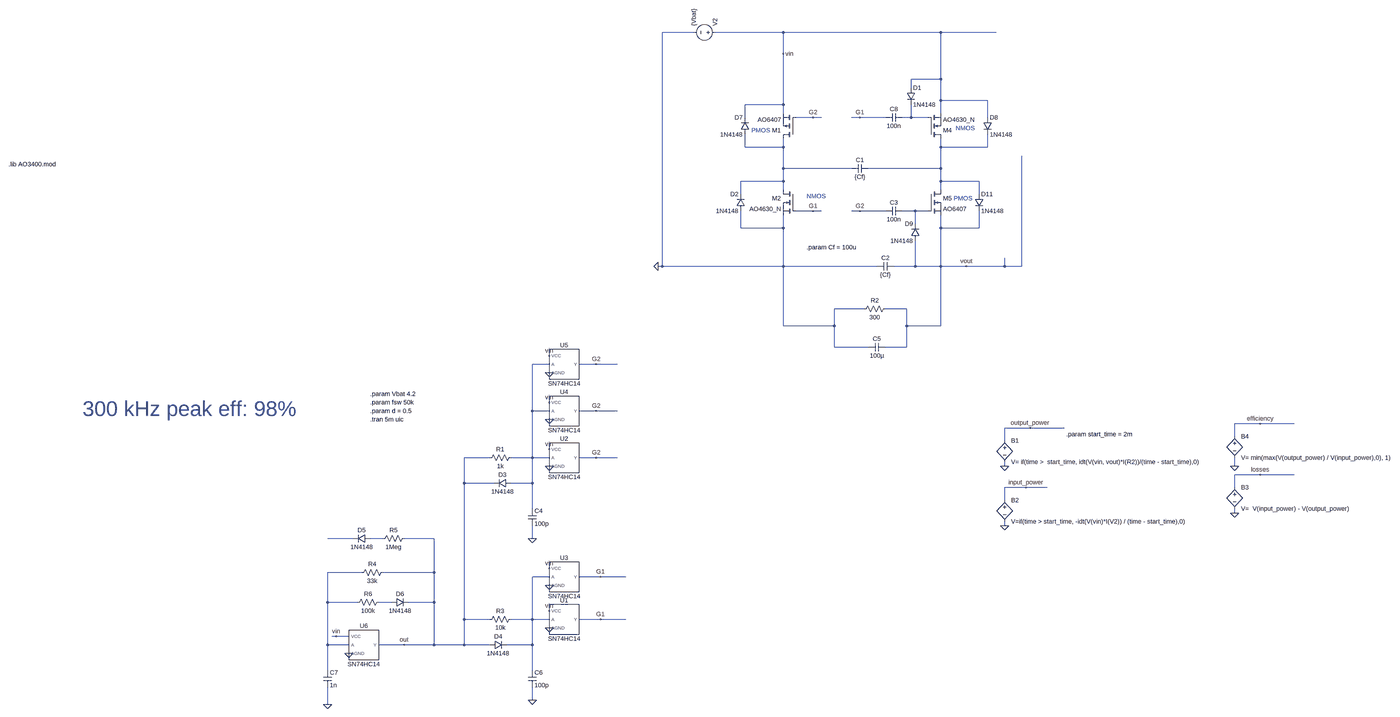
[diagram p0: schematic complete_charge_pump_with_boost.asc, whole sheet]
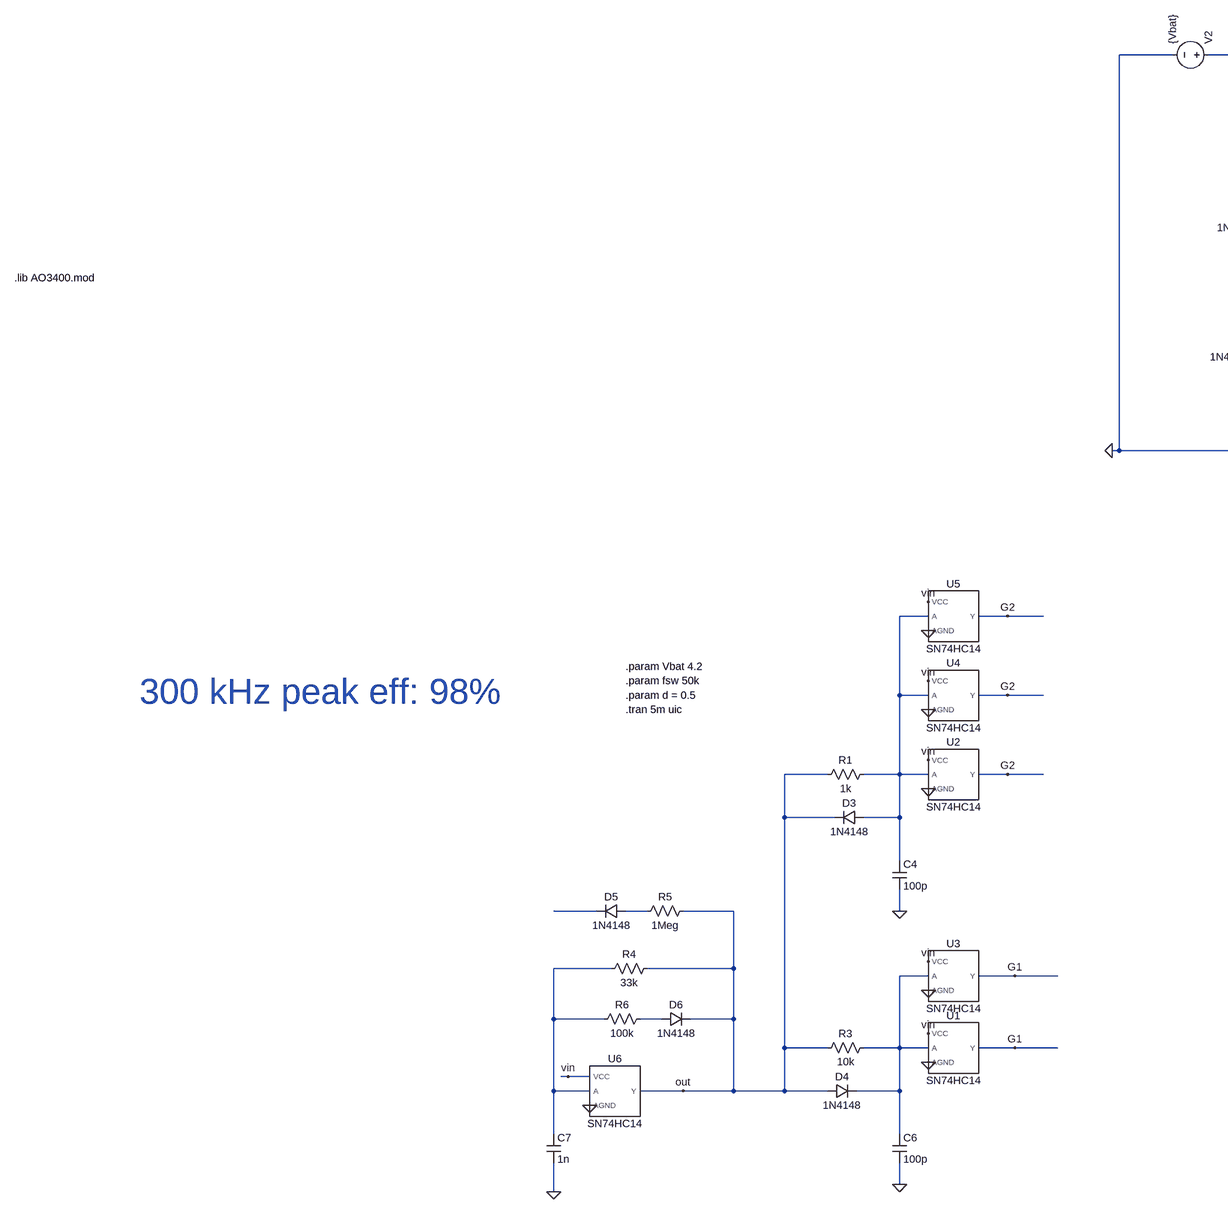
[diagram p1: schematic complete_charge_pump_with_boost.asc, part, row 1 of 1, column 1 of 2]
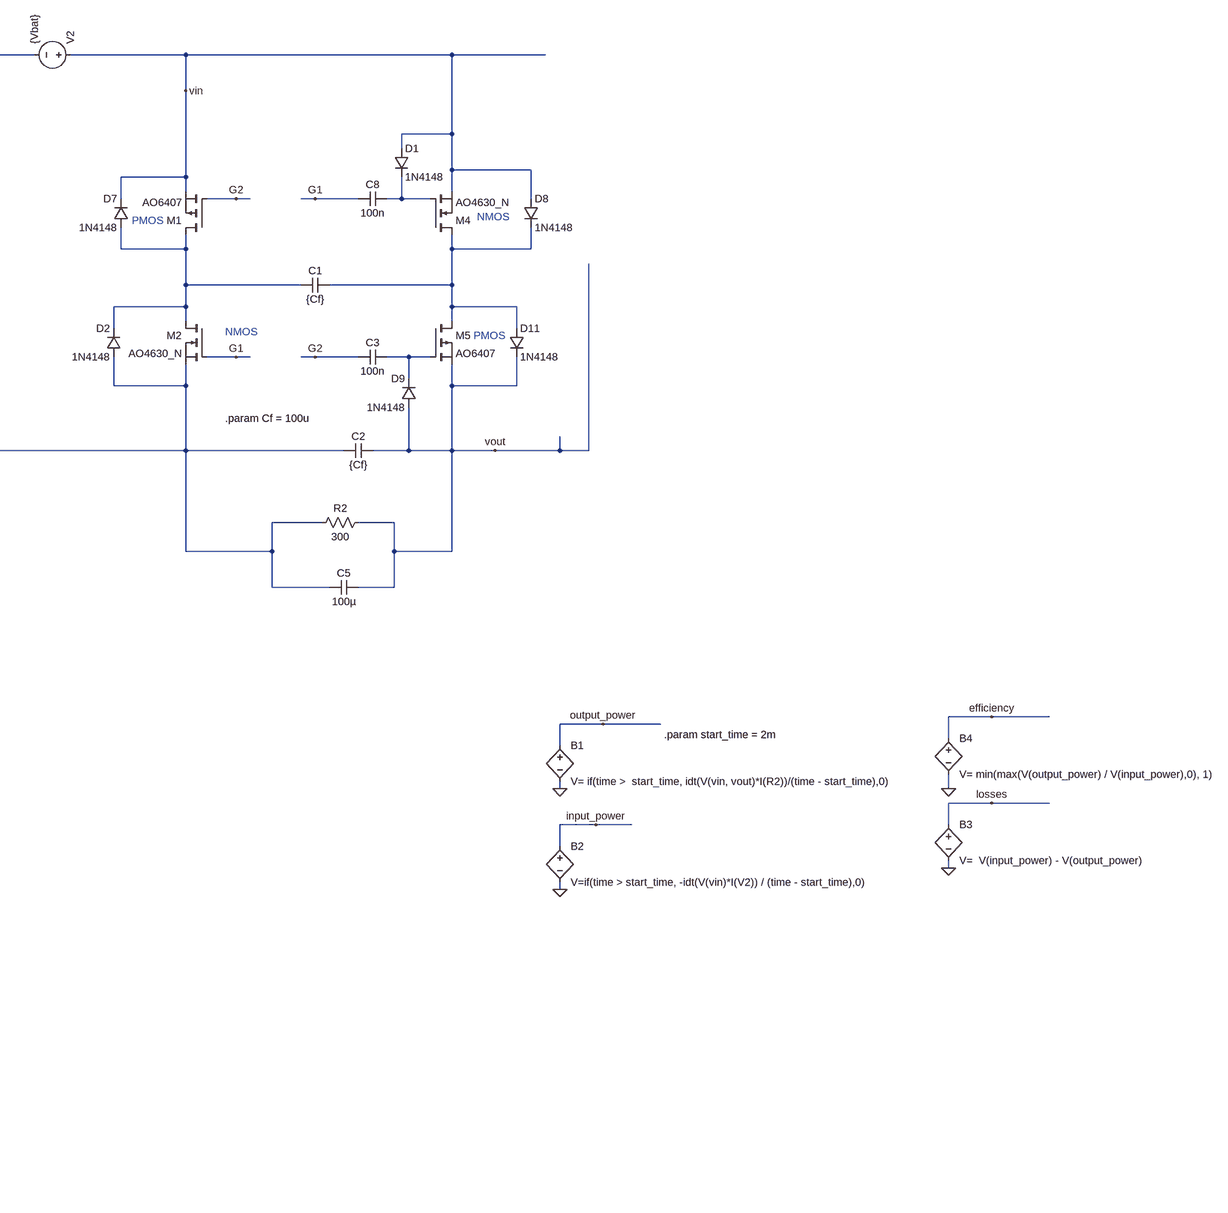
[diagram p2: schematic complete_charge_pump_with_boost.asc, part, row 1 of 1, column 2 of 2]
complete_charge_pump_with_boost.asc, the LTspice schematic file:
Version 4
SHEET 1 11460 3748
WIRE 2096 -384 1824 -384
WIRE 2432 -384 2176 -384
WIRE 3024 -384 2432 -384
WIRE 3232 -384 3024 -384
WIRE 2432 -304 2432 -384
WIRE 3024 -208 3024 -384
WIRE 3024 -208 2912 -208
WIRE 2912 -176 2912 -208
WIRE 3024 -128 3024 -208
WIRE 3200 -128 3024 -128
WIRE 2432 -112 2432 -304
WIRE 2432 -112 2288 -112
WIRE 2432 -80 2432 -112
WIRE 3024 -80 3024 -128
WIRE 2288 -64 2288 -112
WIRE 2544 -64 2480 -64
WIRE 2576 -64 2544 -64
WIRE 2720 -64 2688 -64
WIRE 2816 -64 2720 -64
WIRE 2912 -64 2912 -112
WIRE 2912 -64 2880 -64
WIRE 2976 -64 2912 -64
WIRE 3200 -64 3200 -128
WIRE 2288 48 2288 0
WIRE 2432 48 2432 16
WIRE 2432 48 2288 48
WIRE 3024 48 3024 16
WIRE 3200 48 3200 0
WIRE 3200 48 3024 48
WIRE 2432 128 2432 48
WIRE 2688 128 2432 128
WIRE 3024 128 3024 48
WIRE 3024 128 2752 128
WIRE 2432 176 2432 128
WIRE 2432 176 2272 176
WIRE 3024 176 3024 128
WIRE 3168 176 3024 176
WIRE 2432 208 2432 176
WIRE 3024 208 3024 176
WIRE 2272 224 2272 176
WIRE 3168 224 3168 176
WIRE 2544 288 2480 288
WIRE 2576 288 2544 288
WIRE 2720 288 2688 288
WIRE 2816 288 2720 288
WIRE 2928 288 2880 288
WIRE 2976 288 2928 288
WIRE 2928 336 2928 288
WIRE 2272 352 2272 288
WIRE 2432 352 2432 304
WIRE 2432 352 2272 352
WIRE 3024 352 3024 304
WIRE 3168 352 3168 288
WIRE 3168 352 3024 352
WIRE 1824 496 1824 -384
WIRE 1824 496 1808 496
WIRE 2432 496 2432 352
WIRE 2432 496 1824 496
WIRE 2784 496 2432 496
WIRE 2928 496 2928 400
WIRE 2928 496 2848 496
WIRE 3024 496 3024 352
WIRE 3024 496 2928 496
WIRE 3120 496 3024 496
WIRE 3264 496 3264 464
WIRE 3264 496 3120 496
WIRE 3328 496 3328 80
WIRE 3328 496 3264 496
WIRE 2736 656 2624 656
WIRE 2896 656 2816 656
WIRE 2432 720 2432 496
WIRE 2624 720 2624 656
WIRE 2624 720 2432 720
WIRE 2896 720 2896 656
WIRE 3024 720 3024 496
WIRE 3024 720 2896 720
WIRE 2624 800 2624 720
WIRE 2752 800 2624 800
WIRE 2896 800 2896 720
WIRE 2896 800 2816 800
WIRE 1168 864 1104 864
WIRE 1344 864 1280 864
WIRE 1424 864 1344 864
WIRE 1104 1040 1104 864
WIRE 1168 1040 1104 1040
WIRE 1344 1040 1280 1040
WIRE 1424 1040 1344 1040
WIRE 4224 1088 4128 1088
WIRE 4352 1088 4224 1088
WIRE 3360 1104 3264 1104
WIRE 3488 1104 3360 1104
WIRE 4128 1136 4128 1088
WIRE 3264 1152 3264 1104
WIRE 944 1216 848 1216
WIRE 1104 1216 1104 1040
WIRE 1104 1216 1024 1216
WIRE 1168 1216 1104 1216
WIRE 1344 1216 1280 1216
WIRE 1424 1216 1344 1216
WIRE 3264 1248 3264 1232
WIRE 4128 1248 4128 1216
WIRE 4224 1280 4128 1280
WIRE 4352 1280 4224 1280
WIRE 848 1312 848 1216
WIRE 960 1312 848 1312
WIRE 1104 1312 1104 1216
WIRE 1104 1312 1024 1312
WIRE 3344 1328 3264 1328
WIRE 3424 1328 3344 1328
WIRE 4128 1328 4128 1280
WIRE 3264 1376 3264 1328
WIRE 1104 1408 1104 1312
WIRE 4128 1424 4128 1408
WIRE 3264 1472 3264 1456
WIRE 416 1520 320 1520
WIRE 528 1520 480 1520
WIRE 720 1520 608 1520
WIRE 1104 1520 1104 1472
WIRE 448 1648 320 1648
WIRE 720 1648 720 1520
WIRE 720 1648 528 1648
WIRE 1168 1664 1104 1664
WIRE 1360 1664 1280 1664
WIRE 1456 1664 1360 1664
WIRE 320 1760 320 1648
WIRE 432 1760 320 1760
WIRE 560 1760 512 1760
WIRE 720 1760 720 1648
WIRE 720 1760 624 1760
WIRE 848 1824 848 1312
WIRE 944 1824 848 1824
WIRE 1104 1824 1104 1664
WIRE 1104 1824 1024 1824
WIRE 1168 1824 1104 1824
WIRE 1360 1824 1280 1824
WIRE 1456 1824 1360 1824
WIRE 352 1888 336 1888
WIRE 400 1888 352 1888
WIRE 320 1920 320 1760
WIRE 400 1920 320 1920
WIRE 608 1920 512 1920
WIRE 720 1920 720 1760
WIRE 720 1920 608 1920
WIRE 848 1920 848 1824
WIRE 848 1920 720 1920
WIRE 944 1920 848 1920
WIRE 1104 1920 1104 1824
WIRE 1104 1920 1008 1920
WIRE 320 2016 320 1920
WIRE 1104 2016 1104 1920
WIRE 1104 2128 1104 2080
WIRE 320 2144 320 2080
FLAG 1808 496 0
FLAG 2544 288 G1
FLAG 2544 -64 G2
FLAG 2720 -64 G1
FLAG 3264 1248 0
FLAG 3264 1472 0
FLAG 3360 1104 output_power
FLAG 3344 1328 input_power
FLAG 4128 1248 0
FLAG 4224 1088 efficiency
FLAG 4128 1424 0
FLAG 4224 1280 losses
FLAG 2432 -304 vin
FLAG 3120 496 vout
FLAG 1104 1520 0
FLAG 1104 2128 0
FLAG 1168 1856 0
FLAG 1168 1248 0
FLAG 1168 1184 vin
FLAG 1168 1792 vin
FLAG 1360 1824 G1
FLAG 1344 1216 G2
FLAG 1168 1696 0
FLAG 1168 1632 vin
FLAG 1360 1664 G1
FLAG 1168 1072 0
FLAG 1168 1008 vin
FLAG 1344 1040 G2
FLAG 1168 896 0
FLAG 1168 832 vin
FLAG 1344 864 G2
FLAG 320 2144 0
FLAG 400 1952 0
FLAG 608 1920 out
FLAG 352 1888 vin
FLAG 2720 288 G2
SYMBOL cap 2752 112 R90
WINDOW 0 0 32 VBottom 2
WINDOW 3 32 32 VTop 2
SYMATTR InstName C1
SYMATTR Value {Cf}
SYMBOL cap 2784 512 R270
WINDOW 0 32 32 VTop 2
WINDOW 3 0 32 VBottom 2
SYMATTR InstName C2
SYMATTR Value {Cf}
SYMBOL voltage 2192 -384 M270
WINDOW 123 0 0 Left 0
WINDOW 39 0 0 Left 0
SYMATTR InstName V2
SYMATTR Value {Vbat}
SYMBOL res 2832 640 R90
WINDOW 0 0 56 VBottom 2
WINDOW 3 32 56 VTop 2
SYMATTR InstName R2
SYMATTR Value 300
SYMBOL pmos 2480 16 R180
SYMATTR InstName M1
SYMATTR Value AO6407
SYMBOL nmos 2480 208 M0
SYMATTR InstName M2
SYMATTR Value AO4630_N
SYMBOL nmos 2976 16 M180
SYMATTR InstName M4
SYMATTR Value AO4630_N
SYMBOL bv 3264 1136 R0
SYMATTR InstName B1
SYMATTR Value V= if(time >  start_time, idt(V(vin, vout)*I(R2))/(time - start_time),0)
SYMBOL bv 3264 1360 R0
SYMATTR InstName B2
SYMATTR Value V=if(time > start_time, -idt(V(vin)*I(V2)) / (time - start_time),0)
SYMBOL bv 4128 1312 R0
SYMATTR InstName B3
SYMATTR Value V=  V(input_power) - V(output_power)
SYMBOL bv 4128 1120 R0
SYMATTR InstName B4
SYMATTR Value V= min(max(V(output_power) / V(input_power),0), 1)
SYMBOL res 1040 1200 R90
WINDOW 0 0 56 VBottom 2
WINDOW 3 32 56 VTop 2
SYMATTR InstName R1
SYMATTR Value 1k
SYMBOL cap 1088 1408 R0
SYMATTR InstName C4
SYMATTR Value 100p
SYMBOL diode 1024 1296 R90
WINDOW 0 0 32 VBottom 2
WINDOW 3 32 32 VTop 2
SYMATTR InstName D3
SYMATTR Value 1N4148
SYMBOL res 1040 1808 R90
WINDOW 0 0 56 VBottom 2
WINDOW 3 32 56 VTop 2
SYMATTR InstName R3
SYMATTR Value 10k
SYMBOL diode 944 1936 R270
WINDOW 0 32 32 VTop 2
WINDOW 3 0 32 VBottom 2
SYMATTR InstName D4
SYMATTR Value 1N4148
SYMBOL cap 1088 2016 R0
SYMATTR InstName C6
SYMATTR Value 100p
SYMBOL SN74HC14 1216 1808 R0
SYMATTR InstName U1
SYMBOL SN74HC14 1216 1200 R0
SYMATTR InstName U2
SYMBOL SN74HC14 1216 1648 R0
SYMATTR InstName U3
SYMBOL SN74HC14 1216 1024 R0
SYMATTR InstName U4
SYMBOL SN74HC14 1216 848 R0
SYMATTR InstName U5
SYMBOL cap 2752 816 R270
WINDOW 0 32 32 VTop 2
WINDOW 3 0 32 VBottom 2
SYMATTR InstName C5
SYMATTR Value 100µ
SYMBOL SN74HC14 448 1904 R0
SYMATTR InstName U6
SYMBOL res 544 1632 R90
WINDOW 0 0 56 VBottom 2
WINDOW 3 32 56 VTop 2
SYMATTR InstName R4
SYMATTR Value 33k
SYMBOL cap 304 2016 R0
SYMATTR InstName C7
SYMATTR Value 1n
SYMBOL diode 480 1504 R90
WINDOW 0 0 32 VBottom 2
WINDOW 3 32 32 VTop 2
SYMATTR InstName D5
SYMATTR Value 1N4148
SYMBOL res 624 1504 R90
WINDOW 0 0 56 VBottom 2
WINDOW 3 32 56 VTop 2
SYMATTR InstName R5
SYMATTR Value 1Meg
SYMBOL diode 560 1776 R270
WINDOW 0 32 32 VTop 2
WINDOW 3 0 32 VBottom 2
SYMATTR InstName D6
SYMATTR Value 1N4148
SYMBOL res 416 1776 R270
WINDOW 0 32 56 VTop 2
WINDOW 3 0 56 VBottom 2
SYMATTR InstName R6
SYMATTR Value 100k
SYMBOL diode 2288 288 R180
WINDOW 0 24 64 Left 2
WINDOW 3 24 0 Left 2
SYMATTR InstName D2
SYMATTR Value 1N4148
SYMBOL diode 2304 0 R180
WINDOW 0 24 64 Left 2
WINDOW 3 24 0 Left 2
SYMATTR InstName D7
SYMATTR Value 1N4148
SYMBOL diode 3184 -64 R0
SYMATTR InstName D8
SYMATTR Value 1N4148
SYMBOL diode 2944 400 R180
WINDOW 0 24 64 Left 2
WINDOW 3 24 0 Left 2
SYMATTR InstName D9
SYMATTR Value 1N4148
SYMBOL pmos 2976 208 R0
SYMATTR InstName M5
SYMATTR Value AO6407
SYMBOL diode 3152 224 R0
SYMATTR InstName D11
SYMATTR Value 1N4148
SYMBOL cap 2880 272 R90
WINDOW 0 0 32 VBottom 2
WINDOW 3 32 32 VTop 2
SYMATTR InstName C3
SYMATTR Value 100n
SYMBOL diode 2896 -176 R0
SYMATTR InstName D1
SYMATTR Value 1N4148
SYMBOL cap 2880 -80 R90
WINDOW 0 0 32 VBottom 2
WINDOW 3 32 32 VTop 2
SYMATTR InstName C8
SYMATTR Value 100n
TEXT 480 1008 Left 2 !.param fsw 50k
TEXT 480 1040 Left 2 !.param d = 0.5
TEXT 2520 424 Left 2 !.param Cf = 100u
TEXT 480 1072 Left 2 !.tran 5m uic
TEXT -1536 112 Left 2 !.lib AO3400.mod
TEXT 480 976 Left 2 !.param Vbat 4.2
TEXT 3496 1128 Left 2 !.param start_time = 2m
TEXT -1008 1032 Left 6 ;300 kHz peak eff: 98%
TEXT 2520 232 Left 2 ;NMOS
TEXT 3080 -24 Left 2 ;NMOS
TEXT 3072 240 Left 2 ;PMOS
TEXT 2312 -16 Left 2 ;PMOS

The netlist it stands for:
* complete_charge_pump_with_boost.asc
C1 N003 N002 {Cf}
C2 0 vout {Cf}
V2 vin 0 {Vbat}
R2 vout 0 300
M1 N002 G2 vin vin AO6407
M2 N002 G1 0 0 AO4630_N
M4 N003 N001 vin vin AO4630_N
B1 output_power 0 V= if(time >  start_time, idt(V(vin, vout)*I(R2))/(time - start_time),0)
B2 input_power 0 V=if(time > start_time, -idt(V(vin)*I(V2)) / (time - start_time),0)
B3 losses 0 V=  V(input_power) - V(output_power)
B4 efficiency 0 V= min(max(V(output_power) / V(input_power),0), 1)
R1 N005 out 1k
C4 N005 0 100p
D3 N005 out 1N4148
R3 N009 out 10k
D4 out N009 1N4148
C6 N009 0 100p
XU1 G1 N009 vin 0 SN74HC14  ; pins Y A VCC AGND
XU2 G2 N005 vin 0 SN74HC14  ; pins Y A VCC AGND
XU3 G1 N009 vin 0 SN74HC14  ; pins Y A VCC AGND
XU4 G2 N005 vin 0 SN74HC14  ; pins Y A VCC AGND
XU5 G2 N005 vin 0 SN74HC14  ; pins Y A VCC AGND
C5 0 vout 100µ
XU6 out N008 vin 0 SN74HC14  ; pins Y A VCC AGND
R4 out N008 33k
C7 N008 0 1n
D5 N007 N006 1N4148
R5 out N007 1Meg
D6 N010 out 1N4148
R6 N008 N010 100k
D2 0 N002 1N4148
D7 N002 vin 1N4148
D8 vin N003 1N4148
D9 vout N004 1N4148
M5 N003 N004 vout vout AO6407
D11 N003 vout 1N4148
C3 N004 G2 100n
D1 vin N001 1N4148
C8 N001 G1 100n
.model D D
.lib standard.dio
.model NMOS NMOS
.model PMOS PMOS
.lib standard.mos
.param fsw 50k
.param d = 0.5
.param Cf = 100u
.tran 5m uic
.lib AO3400.mod
.param Vbat 4.2
.param start_time = 2m
* 300 kHz peak eff: 98%
* NMOS
* NMOS
* PMOS
* PMOS
.lib SN74HC14.cir
.backanno
.end